# Altium schematic sheet CAN.SchDoc
size A4; SheetNumber: 2; SheetTotal: 6
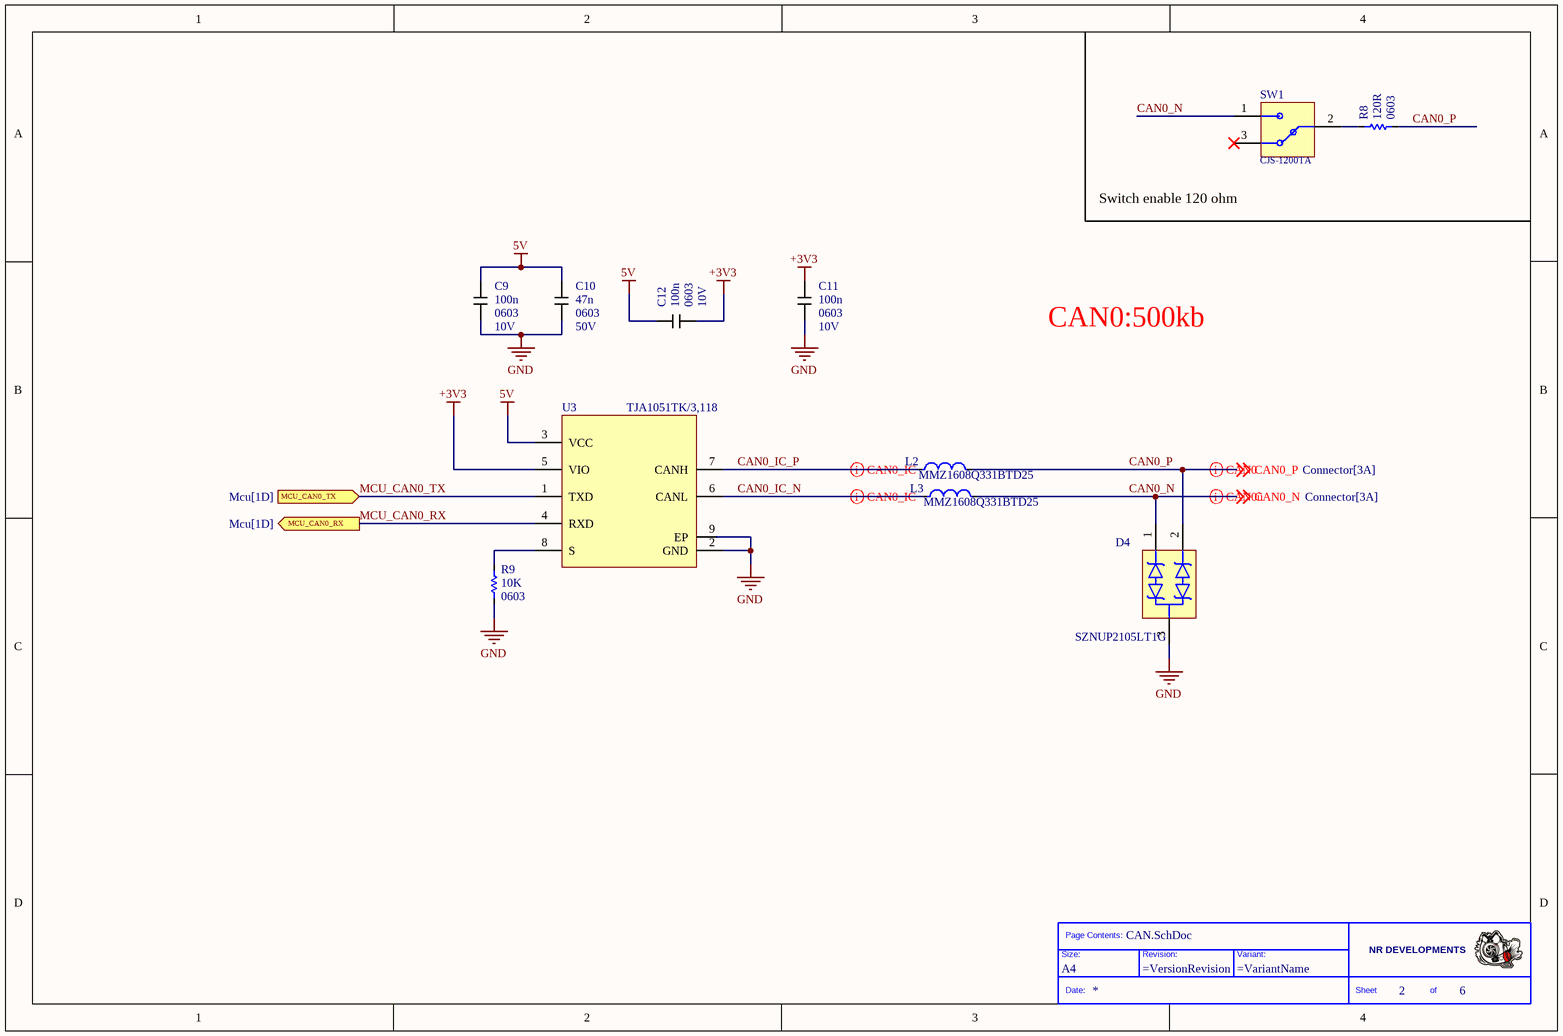
[diagram p0: CAN.SchDoc]

## Parts
*  Size: A4  (hidden comment: Title_Block)  (graphical)
C9  value 100n  Case: 0603  Voltage: 10V  [CAPC1608X09M]  (hidden comment: C0603C104K5RACTU)
C10  value 47n  Case: 0603  Voltage: 50V  [CAPC1608X09M]  (hidden comment: C0603X473K5RAC3316)
C11  value 100n  Case: 0603  Voltage: 10V  [CAPC1608X09M]  (hidden comment: C0603C104K5RACTU)
C12  value 100n  Case: 0603  Voltage: 10V  [CAPC1608X09M]  (hidden comment: C0603C104K5RACTU)
D4  value SZNUP2105LT1G  [SOT95P240X120-3N]  (hidden comment: SM712-02HTG)
L2  value MMZ1608Q331BTD25  [INDC1608X09N]  (hidden comment: BLM18HB331SN1D)
L3  value MMZ1608Q331BTD25  [INDC1608X09N]  (hidden comment: BLM18HB331SN1D)
R8  value 120R  Case: 0603  [RESC1608X06M]  (hidden comment: CRCW0603120RFKEA)
R9  value 10K  Case: 0603  [RESC1608X06M]  (hidden comment: CRCW060310K0FKEA)
SW1  value CJS-1200TA  [SW_CJS-1200TA]  (hidden comment: Switch SPDT)
U3  TJA1051TK/3,118  [SON65P300X300X100-9N-D]

## Ports
MCU_CAN0_RX (out, see Mcu[1D]), MCU_CAN0_TX (in, see Mcu[1D])

## Nets
5V: C9.1 C10.1 C12.1 U3.3(VCC)
+3V3: C11.1 C12.2 U3.5(VIO)
GND: C9.2 C10.2 C11.2 D4.3 R9.1 U3.2(GND) U3.9(EP)
CAN0_IC_N: L3.1 U3.6(CANL)
CAN0_IC_P: L2.1 U3.7(CANH)
CAN0_N: D4.1 L3.2 SW1.1 ; off-sheet CAN0_N
CAN0_P: D4.2 L2.2 R8.1 ; off-sheet CAN0_P
MCU_CAN0_RX: U3.4(RXD) ; port MCU_CAN0_RX
MCU_CAN0_TX: U3.1(TXD) ; port MCU_CAN0_TX
NetR8_2: R8.2 SW1.2
NetR9_2: R9.2 U3.8(S)

Not connected (* = marked no-connect by the designer): SW1 3*

## Layout directives
differential pair: CAN0_IC_N, CAN0_IC_P, CAN0_N, CAN0_P

## Notes on the sheet
- (near SW1) Switch enable 120 ohm
- CAN0:500kb
- (in symbol Title_Block) Page Contents:; NR DEVELOPMENTS; Size:; Revision:; Variant:; Date:; Sheet; of

## Library data of the parts
C9-C12 = CAP: Manufacturer: KEMET; SMD/PTH: SMD
  C9 C11 C12: PartNumber: C0603C104K5RACTU
  C10: PartNumber: C0603X473K5RAC3316
D4 = SM712-02HTG: ESD Diode bid; Manufacturer: Onsemi; SMD/PTH: SMD; Case: SOT23-3; PartNumber: SZNUP2105LT1G
L2 L3 = IND: Manufacturer: TDK; SMD/PTH: SMD; Case: 0603; PartNumber: MMZ1608Q331BTD25
R8 R9 = Resistor: Manufacturer: Vishay; SMD/PTH: SMD
  R8: PartNumber: CRCW0603120RFKEA
  R9: PartNumber: CRCW060310K0FKEA
SW1 = SWITCH_SPDT: Manufacturer: Nidec Components; PartNumber: CJS-1200TA
U3 = TJA1051TK/3: CAN HIGH-SPEED CAN TRANSCEIVER 3.3V / 5V Pin VIO; Manufacturer: NXP Semiconductors; SMD/PTH: SMD; Value: TJA1051TK/3,118; Case: HVSON-8; PartNumber: TJA1051TK/3,118